# Altium schematic sheet Power_Sheet.SchDoc
size A4; DocumentNumber: 2; SheetNumber: 2; SheetTotal: 4
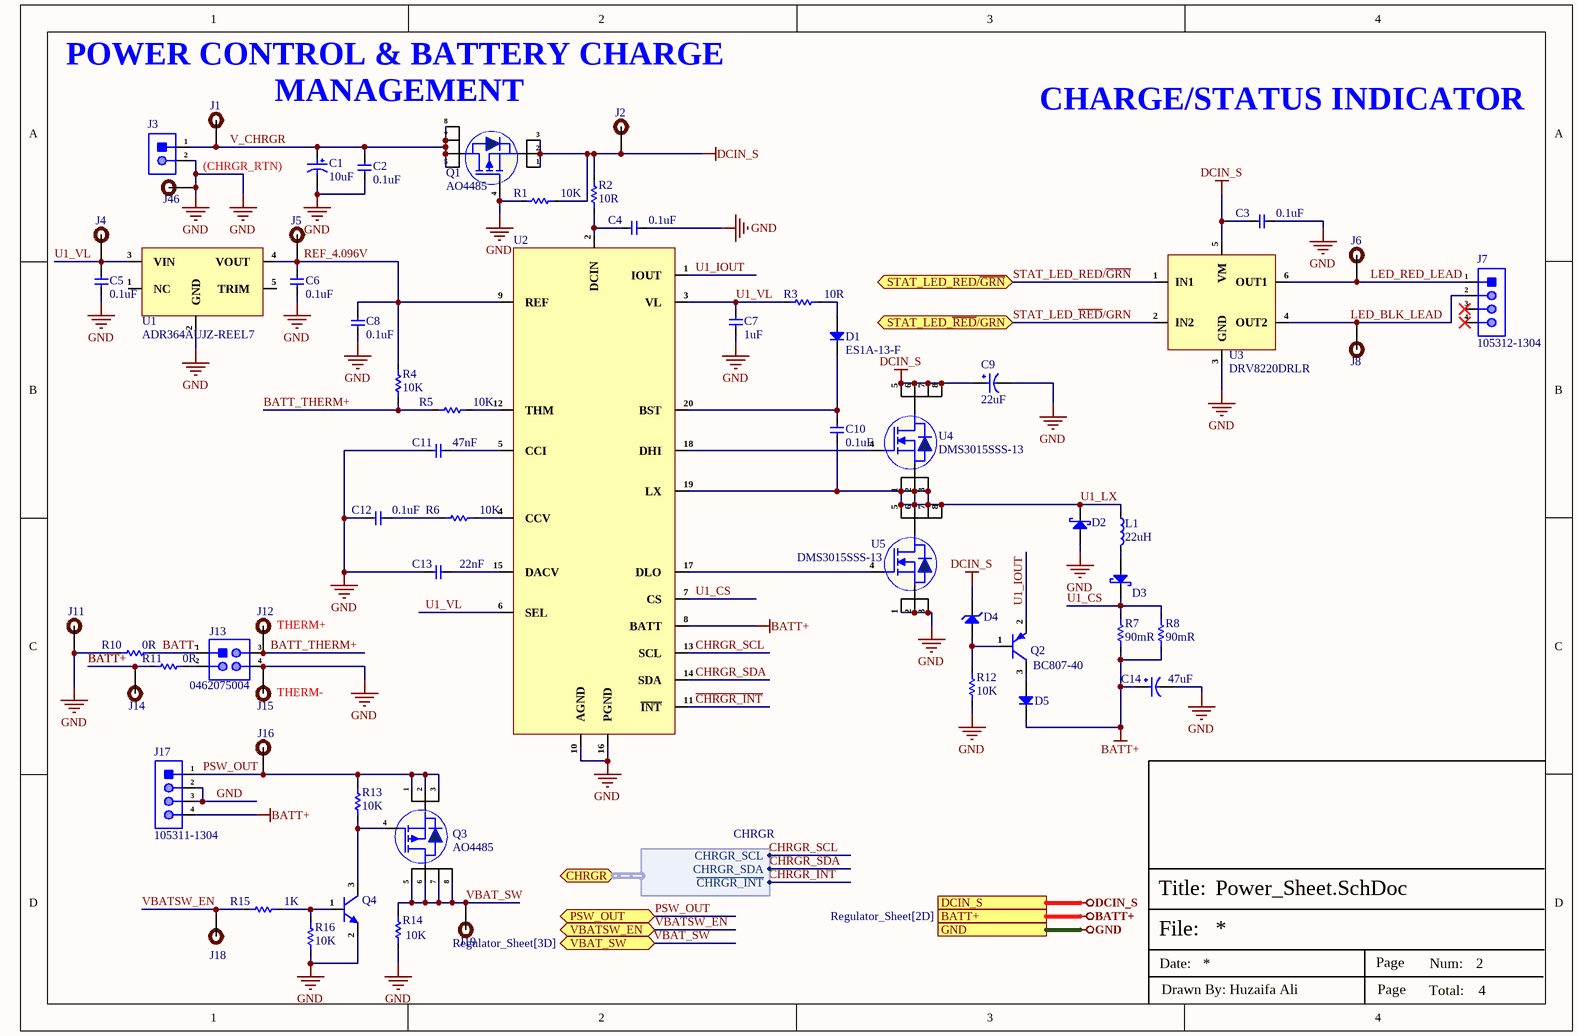
[diagram p0: Power_Sheet.SchDoc]

## Parts
C1  10uF  [EEEFK1E100R_]
C2  0.1uF  [Cap-0603]
C3  0.1uF  [Cap-0402]
C4  0.1uF  [Cap-0402]
C5  0.1uF  [Cap-0402]
C6  0.1uF  [Cap-0402]
C7  1uF  [Cap-0603]
C8  0.1uF  [Cap-0603]
C9  22uF  [Case-D]
C10  0.1uF  [Cap-0402]
C11  47nF  [Cap-0603]
C12  0.1uF  [Cap-0603]
C13  22nF  [Cap-0603]
C14  47uF  [Case-D]
D1  ES1A-13-F  [SMA]
D2  B560CQ-13-F  [SMC]  (value not drawn)
D3  B560CQ-13-F  [SMC]  (value not drawn)
D4  BZD27C4V3P-E3-08  [DO-219AB (SMF)]  (value not drawn)
D5  ES1A-13-F  [SMA]  (value not drawn)
J1  Test Point -TH 1.8mm Hole size 0.92mm  [Test Point -TH 1.8mm Hole size 0.92mm]  (value not drawn)  (no BOM)
J2  Test Point -TH 1.8mm Hole size 0.92mm  [Test Point -TH 1.8mm Hole size 0.92mm]  (value not drawn)  (no BOM)
J3  1053111302  [1053111302]  (value not drawn)
J4  Test Point -TH 1.8mm Hole size 0.92mm  [Test Point -TH 1.8mm Hole size 0.92mm]  (value not drawn)  (no BOM)
J5  Test Point -TH 1.8mm Hole size 0.92mm  [Test Point -TH 1.8mm Hole size 0.92mm]  (value not drawn)  (no BOM)
J6  Test Point -TH 1.8mm Hole size 0.92mm  [Test Point -TH 1.8mm Hole size 0.92mm]  (value not drawn)  (no BOM)
J7  105312-1304  [105312-1304]
J8  Test Point -TH 1.8mm Hole size 0.92mm  [Test Point -TH 1.8mm Hole size 0.92mm]  (value not drawn)  (no BOM)
J11  Test Point -TH 1.8mm Hole size 0.92mm  [Test Point -TH 1.8mm Hole size 0.92mm]  (value not drawn)  (no BOM)
J12  Test Point -TH 1.8mm Hole size 0.92mm  [Test Point -TH 1.8mm Hole size 0.92mm]  (value not drawn)  (no BOM)
J13  0462075004  [0462075004]
J14  Test Point -TH 1.8mm Hole size 0.92mm  [Test Point -TH 1.8mm Hole size 0.92mm]  (value not drawn)  (no BOM)
J15  Test Point -TH 1.8mm Hole size 0.92mm  [Test Point -TH 1.8mm Hole size 0.92mm]  (value not drawn)  (no BOM)
J16  Test Point -TH 1.8mm Hole size 0.92mm  [Test Point -TH 1.8mm Hole size 0.92mm]  (value not drawn)  (no BOM)
J17  105311-1304  [1053111304]
J18  Test Point -TH 1.8mm Hole size 0.92mm  [Test Point -TH 1.8mm Hole size 0.92mm]  (value not drawn)  (no BOM)
J19  Test Point -TH 1.8mm Hole size 0.92mm  [Test Point -TH 1.8mm Hole size 0.92mm]  (value not drawn)  (no BOM)
J46  Test Point -TH 1.8mm Hole size 0.92mm  [Test Point -TH 1.8mm Hole size 0.92mm]  (value not drawn)  (no BOM)
L1  22uH  [DR127-220-R]
Q1  AO4485  [SOIC-8]
Q2  BC807-40  [SOT-23]
Q3  AO4485  [SOIC-8]
Q4  MMBT2222ATT3G  [MMBT2222ATT3G]  (value not drawn)
R1  10K  [Res-0402]
R2  10R  [Res-0402]
R3  10R  [Res-0402]
R4  10K  [Res-0603]
R5  10K  [Res-0603]
R6  10K  [Res-0603]
R7  90mR  [RES-2512]
R8  90mR  [RES-2512]
R10  0R  [Res-0805]
R11  0R  [Res-0805]
R12  10K  [Res-0603]
R13  10K  [Res-0603]
R14  10K  [Res-0603]
R15  1K  [Res-0603]
R16  10K  [Res-0603]
U1  ADR364AUJZ-REEL7  [TSOT-23-5]
U2  MAX1647EAP+  [SSOP-20-208mil]  (value not drawn)
U3  DRV8220DRLR  [SOT-563]
U4  DMS3015SSS-13  [SOP-8]
U5  DMS3015SSS-13  [SOP-8]

## Ports
BATT+ (see Regulator_Sheet[2D]), CHRGR (bidir, harness CHRGR, see Controller_Sheet[4B]), DCIN_S (see Controller_Sheet[4A], Regulator_Sheet[2D]), GND (see Controller_Sheet[4A], Regulator_Sheet[2D]), PSW_OUT (bidir, see Controller_Sheet[4A], Regulator_Sheet[3D]), STAT_LED_RED/~{GRN} (bidir, see Controller_Sheet[3A]), STAT_LED_~{RED}/GRN (bidir, see Controller_Sheet[3B]), VBAT_SW (bidir, see Regulator_Sheet[3D]), VBATSW_EN (bidir, see Controller_Sheet[4A])

## Harnesses
CHRGR: CHRGR_SCL, CHRGR_SDA, ~{CHRGR_INT}

## Nets
BATT+: C14.1 D5.1(K) J14.1 J17.4 R7.2 R8.2 R11.1 U2.8(BATT) ; port BATT+
DCIN_S: C3.1 C9.1 D4.2(K) J2.1 Q1.1(S) Q1.2(S) Q1.3(S) R1.2 R2.2 U3.5(VM) U4.5(D) U4.6(D) U4.7(D) U4.8(D) ; port DCIN_S
GND: C1.2 C2.1 C3.2 C4.2 C5.2 C6.2 C7.2 C8.1 C9.2 C11.1 C12.2 C13.1 C14.2 D2.2(A) J3.2 J11.1 J13.4 J15.1 J17.2 J17.3 J46.1 Q1.4(G) Q4.2(E) R1.1 R10.1 R12.2 R14.1 R16.2 U1.2(GND) U2.10(AGND) U2.16(PGND) U3.3(GND) U5.1(S) U5.2(S) U5.3(S) ; port GND
BATT-: J13.1 R10.2
BATT_THERM+: J12.1 J13.3 R4.2 R5.2
~{CHRGR_INT}: U2.11(~{INT}) ; port CHRGR.~{CHRGR_INT}
CHRGR_SCL: U2.13(SCL) ; port CHRGR.CHRGR_SCL
CHRGR_SDA: U2.14(SDA) ; port CHRGR.CHRGR_SDA
LED_BLK_LEAD: J7.2 J8.1 U3.4(OUT2)
LED_RED_LEAD: J6.1 J7.1 U3.6(OUT1)
PSW_OUT: J16.1 J17.1 Q3.1(S) Q3.2(S) Q3.3(S) R13.1 ; port PSW_OUT
REF_4.096V: C6.1 C8.2 J5.1 R4.1 U1.4(VOUT) U2.9(REF)
STAT_LED_~{RED}/GRN: U3.2(IN2) ; port STAT_LED_~{RED}/GRN
STAT_LED_RED/~{GRN}: U3.1(IN1) ; port STAT_LED_RED/~{GRN}
U1_CS: D3.1(K) R7.1 R8.1 U2.7(CS)
U1_IOUT: Q2.2(E) U2.1(IOUT)
U1_LX: C10.2 D2.1(K) L1.1 U2.19(LX) U4.1(S) U4.2(S) U4.3(S) U5.5(D) U5.6(D) U5.7(D) U5.8(D)
U1_VL: C5.1 C7.1 J4.1 R3.2 U1.3(VIN) U2.3(VL) U2.6(SEL)
V_CHRGR: C1.1 C2.2 J1.1 J3.1 Q1.5(D) Q1.6(D) Q1.7(D) Q1.8(D)
VBAT_SW: J19.1 Q3.5(D) Q3.6(D) Q3.7(D) Q3.8(D) R14.2
VBATSW_EN: J18.1 R15.1 ; port VBATSW_EN
NetC4_1: C4.1 R2.1 U2.2(DCIN)
NetC10_1: C10.1 D1.1(K) U2.20(BST)
NetC11_2: C11.2 U2.5(CCI)
NetC12_1: C12.1 R6.2
NetC13_2: C13.2 U2.15(DACV)
NetD1_2: D1.2(A) R3.1
NetD3_2: D3.2(A) L1.2
NetD4_1: D4.1(A) Q2.1(B) R12.1
NetD5_2: D5.2(A) Q2.3(C)
NetJ13_2: J13.2 R11.2
NetQ3_4: Q3.4(G) Q4.3(C) R13.2
NetQ4_1: Q4.1(B) R15.2 R16.1
NetR5_1: R5.1 U2.12(THM)
NetR6_1: R6.1 U2.4(CCV)
NetU2_17: U2.17(DLO) U5.4(G)
NetU2_18: U2.18(DHI) U4.4(G)

Not connected (* = marked no-connect by the designer): J7 3* 4*; U1 1(NC) 5(TRIM)

## Notes on the sheet
- POWER CONTROL & BATTERY CHARGE
  MANAGEMENT
- CHARGE/STATUS INDICATOR
- (CHRGR_RTN)
- (near J12) THERM+
- (near J15) THERM-
- Labels drawn without touching a wire or pin: VBAT_SW
- File:
- Title:
- Date:
- Page
- Num:
- Total:
- Drawn By: Huzaifa Ali

## Library data of the parts
C1 = EEEFK1E100R: CAP ALUM 10UF 20% 25V SMD; Manufacturer: Panasonic; Manufacturer Part Number: EEE-FK1E100R; Dielectric Material: Aluminium; Ripple Current: 90mA; ESR (Equivalent Series Resistance): 1.35R; Polarity: Polar; Life (Hours): 2000Hour; Leakage Current: 3uA; Supplier 1: Digi-Key; Stock 1: 332; Pricing 1: 1=0.38, 10=0.264, 50=0.1852, 100=0.1587, 500=0.11902, 1000=0.10051 (USD); Mount: Surface Mount,PCB; Case/Package: Radial; Number of Pins: 2; Contact Plating: Tin; Min Operating Temperature: -55°C; Max Operating Temperature: 105°C; Capacitance: 10uF; Tolerance: 20%; Voltage Rating (DC): 25V; Packaging: Tape and Reel; Voltage Rating: 25V; Ripple Current (AC): 90mA; Impedance: 1.35R; Package Quantity: 1; Termination: SMD/SMT; Voltage: 25V; Series: FK; Construction: Cylindrical; Diameter: 4mm; Length: 5.8mm; Width: 5.5mm; Height: 5.8mm; Height - Seated (Max): 0.24inch; Radiation Hardening: No; REACH SVHC: No SVHC; Lead Free: Lead Free; RoHS Compliant: Yes; ComponentLink1URL: http://www.jameco.com/Jameco/Products/ProdDS/1357642.pdf?src-supplier=Jameco; ComponentLink1Description: http://www.jameco.com/Jameco/Products/ProdDS/1357642.pdf?src-supplier=Jameco; ComponentLink2URL: http://www.farnell.com/datasheets/2002520.pdf?src-supplier=Farnell; ComponentLink2Description: http://www.farnell.com/datasheets/2002520.pdf?src-supplier=Farnell; ComponentLink3URL: http://www.farnell.com/datasheets/58258.pdf?src-supplier=Element14; ComponentLink3Description: http://www.farnell.com/datasheets/58258.pdf?src-supplier=Element14; ComponentLink4URL: http://www.mouser.com/ds/2/315/ABA0000CE120-68386.pdf?src-supplier=Mouser; ComponentLink4Description: http://www.mouser.com/ds/2/315/ABA0000CE120-68386.pdf?src-supplier=Mouser; ComponentLink5URL: http://uk.rs-online.com/webdocs/139e/0900766b8139e400.pdf?src-supplier=RSComponents; ComponentLink5Description: http://uk.rs-online.com/webdocs/139e/0900766b8139e400.pdf?src-supplier=RSComponents; ComponentLink6URL: http://www.farnell.com/datasheets/2813657.pdf?src-supplier=Farnell; ComponentLink6Description: http://www.farnell.com/datasheets/2813657.pdf?src-supplier=Farnell; ComponentLink7URL: http://www.farnell.com/datasheets/2002520.pdf?src-supplier=Element14; ComponentLink7Description: http://www.farnell.com/datasheets/2002520.pdf?src-supplier=Element14; ComponentLink8URL: http://www.farnell.com/datasheets/1676921.pdf?src-supplier=Element14; ComponentLink8Description: http://www.farnell.com/datasheets/1676921.pdf?src-supplier=Element14; ComponentLink9URL: http://industrial.panasonic.com/www-data/pdf/ABA0000/ABA0000CE120.pdf?src-supplier=Avnet; ComponentLink9Description: http://industrial.panasonic.com/www-data/pdf/ABA0000/ABA0000CE120.pdf?src-supplier=Avnet; ComponentLink10URL: http://industrial.panasonic.com/www-data/pdf/ABA0000/ABA0000CE120.pdf?src-supplier=Future+Electronics; ComponentLink10Description: http://industrial.panasonic.com/www-data/pdf/ABA0000/ABA0000CE120.pdf?src-supplier=Future+Electronics; ComponentLink11URL: https://www.verical.com/server-webapp/html/getDatasheet?partID=134702&src-supplier=Verical; ComponentLink11Description: https://www.verical.com/server-webapp/html/getDatasheet?partID=134702&src-supplier=Verical; ComponentLink12URL: http://industrial.panasonic.com/www-data/pdf/ABA0000/ABA0000CE120.pdf?src-supplier=Avnet+Europe; ComponentLink12Description: http://industrial.panasonic.com/www-data/pdf/ABA0000/ABA0000CE120.pdf?src-supplier=Avnet+Europe; Supplier Part Number 1: PCE3795CT-ND; LCSC Part Number: C178538
C2 C8 C12 = CL10B104KB8NNNC: CAP CER 0.1UF 50V X7R 0603; Manufacturer: Samsung; Material: Ceramic; Capacitance: 100nF; Tolerance: 10%; Supplier 1: Digi-Key; Manufacturer Part Number: CL10B104KB8NNNC; RoHS: Yes; Category: Ceramic Capacitors; Stock 1: 3998791; Pricing 1: 1=0.10000, 10=0.03000, 50=0.01640, 100=0.01340, 500=0.00954, 1000=0.00750 (USD); Mount: Surface Mount; Case/Package: 0603; Case Code (Metric): 1608; Case Code (Imperial): 0603; Contact Plating: Tin; Min Operating Temperature: -55°C; Max Operating Temperature: 125°C; Dielectric: X7R; Voltage Rating: 50V; Package Quantity: 1; Packaging: Tape and Reel; Voltage: 50V; Voltage Rating (DC): 50V; Series: CL; Construction: Flat; Length: 1.6mm; Width: 0.031inch; Height: 0.8mm; Depth: 0.8mm; Thickness: 0.035inch; Radiation Hardening: No; Lead Free: Lead Free; RoHS Compliant: Yes; ComponentLink1URL: https://datasheet.ciiva.com/25803/cl10b104kb8nnnc-25803393.pdf?src-supplier=Digi-Key; ComponentLink1Description: https://datasheet.ciiva.com/25803/cl10b104kb8nnnc-25803393.pdf?src-supplier=Digi-Key; ComponentLink2URL: https://datasheet.ciiva.com/26838/getdatasheetpartid-89097-26838411.pdf?src-supplier=Verical; ComponentLink2Description: https://datasheet.ciiva.com/26838/getdatasheetpartid-89097-26838411.pdf?src-supplier=Verical; ComponentLink3URL: https://datasheet.ciiva.com/29198/456651-da-01-en-vs-kondensator-0605-29198839.pdf?src-supplier=Conrad; ComponentLink3Description: https://datasheet.ciiva.com/29198/456651-da-01-en-vs-kondensator-0605-29198839.pdf?src-supplier=Conrad; Supplier Part Number 1: 1276-1000-1-ND; LCSC Part Number: C1591
C3-C6 C10 = GRM155R71C104KA88D: CAP CER 0.1UF 16V X7R 0402; Manufacturer: Murata; Material: Ceramic; Value: 100nF; Tolerance: 10%; Insulation Resistance: 10GR; Item Type: Capacitor; Supplier 1: Arrow Electronics; Manufacturer Part Number: GRM155R71C104KA88D; RoHS: Yes; Category: Ceramic Capacitors; Stock 1: 1690322; Pricing 1: 10000=0.00480, 30000=0.00470, 100000=0.00350, 250000=0.00330 (USD); Mounting Technology: Surface Mount; Case/Package: 0402; Pins: 2; Case Code (Metric): 1005; Case Code (Imperial): 0402; Dielectric Material: Ceramic; Min Operating Temperature: -55°C; Max Operating Temperature: 125°C; Voltage Rating: 16V; Packaging: Tape and Reel; Voltage Rating (DC): 16V; Package Quantity: 1; Dielectric: X7R; Termination: SMD/SMT; Voltage: 16V; Series: GRM; Length: 1mm; Width: 0.02inch; Height: 0.5mm; Thickness: 0.022inch; Depth: 0.5mm; Radiation Hardening: No; Lead Free: Lead Free; RoHS Compliant: Yes; ComponentLink1URL: https://datasheet.ciiva.com/129/grm155r71c104ka88-01-129739.pdf?src-supplier=Digi-Key; ComponentLink1Description: https://datasheet.ciiva.com/129/grm155r71c104ka88-01-129739.pdf?src-supplier=Digi-Key; ComponentLink2URL: https://datasheet.ciiva.com/129/grm155r71c104ka88-01-129740.pdf?src-supplier=Digi-Key; ComponentLink2Description: https://datasheet.ciiva.com/129/grm155r71c104ka88-01-129740.pdf?src-supplier=Digi-Key; ComponentLink3URL: https://datasheet.ciiva.com/18102/getdatasheetpartid-85307-18102905.pdf?src-supplier=Verical; ComponentLink3Description: https://datasheet.ciiva.com/18102/getdatasheetpartid-85307-18102905.pdf?src-supplier=Verical; ComponentLink4URL: https://datasheet.ciiva.com/29199/454098-da-01-en-vs-kondensator-0402-29199799.pdf?src-supplier=Conrad; ComponentLink4Description: https://datasheet.ciiva.com/29199/454098-da-01-en-vs-kondensator-0402-29199799.pdf?src-supplier=Conrad; ComponentLink5URL: https://datasheet.ciiva.com/7937/4360-7937615.pdf?src-supplier=Element14; ComponentLink5Description: https://datasheet.ciiva.com/7937/4360-7937615.pdf?src-supplier=Element14; ComponentLink6URL: https://datasheet.ciiva.com/14116/grmseries-highdielectrictype-eng-14116878.pdf?src-supplier=Distrelec; ComponentLink6Description: https://datasheet.ciiva.com/14116/grmseries-highdielectrictype-eng-14116878.pdf?src-supplier=Distrelec; ComponentLink7URL: https://datasheet.ciiva.com/14103/grmseries-highdielectrictype-eng-14103750.pdf?src-supplier=Distrelec; ComponentLink7Description: https://datasheet.ciiva.com/14103/grmseries-highdielectrictype-eng-14103750.pdf?src-supplier=Distrelec; ComponentLink8URL: https://datasheet.ciiva.com/28534/4360-28534127.pdf?src-supplier=Element14; ComponentLink8Description: https://datasheet.ciiva.com/28534/4360-28534127.pdf?src-supplier=Element14; ComponentLink9URL: https://datasheet.ciiva.com/28534/4360-28534133.pdf?src-supplier=Element14; ComponentLink9Description: https://datasheet.ciiva.com/28534/4360-28534133.pdf?src-supplier=Element14; ComponentLink10URL: https://datasheet.ciiva.com/16199/product-16199000.pdf?src-supplier=Future+Electronics; ComponentLink10Description: https://datasheet.ciiva.com/16199/product-16199000.pdf?src-supplier=Future+Electronics; Supplier Part Number 1: GRM155R71C104KA88D; LCSC Part Number: C71629
C7 = CC0603KRX5R8BB105: CAP CER 1UF 25V X5R 0603; Manufacturer: Yageo; Tolerance: 10%; Item Type: Capacitor; Supplier 1: Digi-Key; Manufacturer Part Number: CC0603KRX5R8BB105; RoHS: Yes; Category: Ceramic Capacitors; Stock 1: 919939; Pricing 1: 1=0.12000, 10=0.08400, 50=0.04760, 100=0.03940, 500=0.02764, 1000=0.02288 (USD); Mount: Surface Mount; Case/Package: 0603; Number of Pins: 2; Case Code (Metric): 1608; Case Code (Imperial): 0603; Min Operating Temperature: -55°C; Max Operating Temperature: 85°C; Capacitance: 1uF; Dielectric: X5R; Package Quantity: 1; Voltage Rating: 25V; Packaging: Tape and Reel; Termination: SMD/SMT; Voltage Rating (DC): 25V; Series: CC; Construction: Flat; Length: 1.6mm; Width: 0.031inch; Height: 0.8mm; Thickness: 0.035inch; Depth: 0.8mm; Radiation Hardening: No; REACH SVHC: No SVHC; Lead Free: Lead Free; Halogen Free: Halogen Free; RoHS Compliant: Yes; ComponentLink1URL: https://datasheet.ciiva.com/176/mlccorderingcode-176785.pdf?src-supplier=Digi-Key; ComponentLink1Description: https://datasheet.ciiva.com/176/mlccorderingcode-176785.pdf?src-supplier=Digi-Key; ComponentLink2URL: https://datasheet.ciiva.com/176/mlccorderingcode-176786.pdf?src-supplier=Digi-Key; ComponentLink2Description: https://datasheet.ciiva.com/176/mlccorderingcode-176786.pdf?src-supplier=Digi-Key; ComponentLink3URL: https://datasheet.ciiva.com/176/mlccorderingcode-176787.pdf?src-supplier=Digi-Key; ComponentLink3Description: https://datasheet.ciiva.com/176/mlccorderingcode-176787.pdf?src-supplier=Digi-Key; ComponentLink4URL: https://datasheet.ciiva.com/17436/upy-gphc-x5r-4v-to-50v-12-17436952.pdf?src-supplier=Avnet+Europe; ComponentLink4Description: https://datasheet.ciiva.com/17436/upy-gphc-x5r-4v-to-50v-12-17436952.pdf?src-supplier=Avnet+Europe; ComponentLink5URL: https://datasheet.ciiva.com/7978/1525783-7978171.pdf?src-supplier=Element14; ComponentLink5Description: https://datasheet.ciiva.com/7978/1525783-7978171.pdf?src-supplier=Element14; ComponentLink6URL: https://datasheet.ciiva.com/11586/upy-gphc-x5r-4v-to-50v-12-11586318.pdf?src-supplier=Avnet; ComponentLink6Description: https://datasheet.ciiva.com/11586/upy-gphc-x5r-4v-to-50v-12-11586318.pdf?src-supplier=Avnet; Supplier Part Number 1: 311-1445-1-ND; LCSC Part Number: C14664
C9 = T495D226K035ATE3007280: CAP TANT 22UF 10% 35V 2917; Manufacturer: KEMET; Item Type: Capacitor; ESR (Equivalent Series Resistance): 300mR; Polarity: Polar; Dissipation Factor: 6%; Supplier: Digikey; LCSC Part Number: C122326; Manufacturer Part Number: T495D226K035ATE3007280; RoHS: Yes; Pricing: 2500=0.57649 (USD); Case/Package: Molded; Min Operating Temperature: -55°C; Max Operating Temperature: 125°C; Value: 22uF; Tolerance: 10%; Packaging: Tape and Reel; Construction: Flat; Length: 7.3mm; Height: 2.8mm; Depth: 4.3mm; Radiation Hardening: No; RoHS Compliant: Yes; ComponentLink1URL: http://components.arrow.com/part/dataview/42155055S8669486N7429?src-supplier=Arrow+Electronics; ComponentLink1Description: http://components.arrow.com/part/dataview/42155055S8669486N7429?src-supplier=Arrow+Electronics; ComponentLink2URL: http://capacitoredge.kemet.com/capedge2/DataSheet?pn=T495D226K035ATE3007280&src-supplier=Avnet; ComponentLink2Description: http://capacitoredge.kemet.com/capedge2/DataSheet?pn=T495D226K035ATE3007280&src-supplier=Avnet
C11 = CGA3E2X8R1H473M080AA: CAP CER 0.047UF 50V X8R 0603; Manufacturer: TDK; Tolerance: 20%; Item Type: Capacitor; Supplier 1: Digi-Key; Manufacturer Part Number: CGA3E2X8R1H473M080AA; RoHS: Yes; Category: Ceramic Capacitors; Stock 1: 1279; Pricing 1: 1=0.16000, 10=0.11200, 50=0.06360, 100=0.05260, 500=0.03690, 1000=0.03055 (USD); Mount: Surface Mount; Case/Package: 0603; Case Code (Metric): 1608; Weight: 7.1E-05oz; Case Code (Imperial): 0603; Min Operating Temperature: -55°C; Max Operating Temperature: 150°C; Dielectric: X8R; Voltage Rating (DC): 50V; Package Quantity: 4000; Packaging: Tape and Reel; Capacitance: 47nF; Voltage Rating: 50V; Features: High Temperature; Length: 0.063inch; Width: 0.031inch; Height: 0.8mm; Thickness: 0.035inch; Ratings: AEC-Q200; ComponentLink1URL: http://www.mouser.com/ds/2/400/mlcc_automotive_hightemp_en-520039.pdf?src-supplier=Mouser; ComponentLink1Description: http://www.mouser.com/ds/2/400/mlcc_automotive_hightemp_en-520039.pdf?src-supplier=Mouser; ComponentLink2URL: https://product.tdk.com/info/en/catalog/spec/mlccspec_automotive_hightemp_en.pdf?src-supplier=Digi-Key; ComponentLink2Description: https://product.tdk.com/info/en/catalog/spec/mlccspec_automotive_hightemp_en.pdf?src-supplier=Digi-Key; ComponentLink3URL: http://product.tdk.com/en/catalog/datasheets/mlcc_automotive_hightemp_en.pdf?src-supplier=Avnet; ComponentLink3Description: http://product.tdk.com/en/catalog/datasheets/mlcc_automotive_hightemp_en.pdf?src-supplier=Avnet; Supplier Part Number 1: 445-12603-1-ND; LCSC Part Number: C2172709
C13 = CC0603KRX7R9BB223: CAP CER 0.022UF 50V X7R 0603; Manufacturer: Yageo; Dielectric Material: Ceramic; Tolerance: 10%; Insulation Resistance: 100GR; Item Type: Capacitor; Supplier 1: Digi-Key; Manufacturer Part Number: CC0603KRX7R9BB223; RoHS: Yes; Category: Ceramic Capacitors; Stock 1: 119735; Pricing 1: 1=0.10000, 10=0.05500, 50=0.03020, 100=0.02460, 500=0.01760, 1000=0.01383 (USD); Mount: Surface Mount; Case/Package: 0603; Number of Pins: 2; Case Code (Metric): 1608; Case Code (Imperial): 0603; Min Operating Temperature: -55°C; Max Operating Temperature: 125°C; Capacitance: 22nF; Dielectric: X7R; Voltage: 50V; Package Quantity: 1; Voltage Rating: 50V; Packaging: Tape and Reel; Voltage Rating (DC): 50V; Termination: SMD/SMT; Resistor Type: Ceramic; Series: CC; Length: 1.6mm; Width: 0.031inch; Height: 0.8mm; Depth: 0.8mm; Thickness: 0.035inch; Radiation Hardening: No; RoHS Compliant: Yes; REACH SVHC: No SVHC; Lead Free: Lead Free; Halogen Free: Halogen Free; ComponentLink1URL: https://datasheet.ciiva.com/8033/70765-8033869.pdf?src-supplier=Element14; ComponentLink1Description: https://datasheet.ciiva.com/8033/70765-8033869.pdf?src-supplier=Element14; ComponentLink2URL: https://datasheet.ciiva.com/28450/1489800-28450639.pdf?src-supplier=Element14; ComponentLink2Description: https://datasheet.ciiva.com/28450/1489800-28450639.pdf?src-supplier=Element14; ComponentLink3URL: https://datasheet.ciiva.com/8033/1489800-8033867.pdf?src-supplier=Element14; ComponentLink3Description: https://datasheet.ciiva.com/8033/1489800-8033867.pdf?src-supplier=Element14; ComponentLink4URL: https://datasheet.ciiva.com/8033/1489800-8033865.pdf?src-supplier=Element14; ComponentLink4Description: https://datasheet.ciiva.com/8033/1489800-8033865.pdf?src-supplier=Element14; ComponentLink5URL: https://datasheet.ciiva.com/156/mlccorderingcode-156178.pdf?src-supplier=Digi-Key; ComponentLink5Description: https://datasheet.ciiva.com/156/mlccorderingcode-156178.pdf?src-supplier=Digi-Key; ComponentLink6URL: https://datasheet.ciiva.com/156/mlccorderingcode-156177.pdf?src-supplier=Digi-Key; ComponentLink6Description: https://datasheet.ciiva.com/156/mlccorderingcode-156177.pdf?src-supplier=Digi-Key; ComponentLink7URL: https://datasheet.ciiva.com/156/mlccorderingcode-156179.pdf?src-supplier=Digi-Key; ComponentLink7Description: https://datasheet.ciiva.com/156/mlccorderingcode-156179.pdf?src-supplier=Digi-Key; ComponentLink8URL: https://datasheet.ciiva.com/11464/upy-gphc-x7r-6-3v-to-50v-8-11464741.pdf?src-supplier=Avnet; ComponentLink8Description: https://datasheet.ciiva.com/11464/upy-gphc-x7r-6-3v-to-50v-8-11464741.pdf?src-supplier=Avnet; Supplier Part Number 1: 311-1370-1-ND; LCSC Part Number: C106222
C14 = T495D476K025ATE250: CAP TANT 47UF 10% 25V 2917; Manufacturer: KEMET; Item Type: Capacitor; Supplier: Mouser; LCSC Part Number: C1952924; Manufacturer Part Number: T495D476K025ATE250; RoHS: Yes; Stock: 2198; Pricing: 1=1.82, 10=1.29, 50=1.29, 100=1.07, 1000=0.751, 10000=0.67 (USD); ComponentLink1URL: http://www.mouser.com/ds/2/212/KEM_T2071_T495_COTS-1104607.pdf?src-supplier=Mouser; ComponentLink1Description: http://www.mouser.com/ds/2/212/KEM_T2071_T495_COTS-1104607.pdf?src-supplier=Mouser; ComponentLink2URL: http://components.arrow.com/part/dataview/43511451S7939771N7429?src-supplier=Arrow+Electronics; ComponentLink2Description: http://components.arrow.com/part/dataview/43511451S7939771N7429?src-supplier=Arrow+Electronics; ComponentLink3URL: https://datasheet.octopart.com/T495D476K025ATE250-Kemet-datasheet-27203288.pdf?src-supplier=Element14; ComponentLink3Description: https://datasheet.octopart.com/T495D476K025ATE250-Kemet-datasheet-27203288.pdf?src-supplier=Element14; ComponentLink4URL: https://datasheet.octopart.com/T495D476K025ATE250-Kemet-datasheet-9873475.pdf?src-supplier=Newark; ComponentLink4Description: https://datasheet.octopart.com/T495D476K025ATE250-Kemet-datasheet-9873475.pdf?src-supplier=Newark; ComponentLink5URL: http://www.kemet.com/Lists/ProductCatalog/Attachments/261/KEM_T2009_T495.pdf?src-supplier=Avnet; ComponentLink5Description: http://www.kemet.com/Lists/ProductCatalog/Attachments/261/KEM_T2009_T495.pdf?src-supplier=Avnet; ComponentLink6URL: https://api.kemet.com/component-edge/download/datasheet/T495D476K025ATE250.pdf?src-supplier=Digikey; ComponentLink6Description: https://api.kemet.com/component-edge/download/datasheet/T495D476K025ATE250.pdf?src-supplier=Digikey; ComponentLink7URL: https://datasheet.octopart.com/T495D476K025ATE250-KEMET-datasheet-102476631.pdf?src-supplier=Farnell; ComponentLink7Description: https://datasheet.octopart.com/T495D476K025ATE250-KEMET-datasheet-102476631.pdf?src-supplier=Farnell; ComponentLink8URL: https://datasheet.octopart.com/T495D476K025ATE250-KEMET-datasheet-130110683.pdf?src-supplier=TME; ComponentLink8Description: https://datasheet.octopart.com/T495D476K025ATE250-KEMET-datasheet-130110683.pdf?src-supplier=TME
D1 D5 = ES1A-13-F: DIODE GEN PURP 50V 1A SMA; Manufacturer: Diodes; Supplier: Digikey; LCSC Part Number: C674398; Manufacturer Part Number: ES1A-13-F; RoHS: Yes; Item Type: Diodes; Stock: 130862; Pricing: 1=0.47, 10=0.336, 100=0.1693, 500=0.15004, 1000=0.11676, 2000=0.1045 (USD); ComponentLink1URL: https://datasheet.ciiva.com/27052/1540279-27052395.pdf?src-supplier=Jameco; ComponentLink1Description: https://datasheet.ciiva.com/27052/1540279-27052395.pdf?src-supplier=Jameco; ComponentLink2URL: https://datasheet.ciiva.com/7964/ds14001-7964264.pdf?src-supplier=Element14; ComponentLink2Description: https://datasheet.ciiva.com/7964/ds14001-7964264.pdf?src-supplier=Element14; ComponentLink3URL: https://datasheet.ciiva.com/913/ds14001-913221.pdf?src-supplier=Digikey; ComponentLink3Description: https://datasheet.ciiva.com/913/ds14001-913221.pdf?src-supplier=Digikey; ComponentLink4URL: https://datasheet.ciiva.com/913/ds14001-913222.pdf?src-supplier=Digikey; ComponentLink4Description: https://datasheet.ciiva.com/913/ds14001-913222.pdf?src-supplier=Digikey; ComponentLink5URL: https://datasheet.ciiva.com/913/ds14001-913223.pdf?src-supplier=Digikey; ComponentLink5Description: https://datasheet.ciiva.com/913/ds14001-913223.pdf?src-supplier=Digikey; ComponentLink6URL: https://datasheet.ciiva.com/15144/getdatasheetpartid-89769-15144650.pdf?src-supplier=Verical; ComponentLink6Description: https://datasheet.ciiva.com/15144/getdatasheetpartid-89769-15144650.pdf?src-supplier=Verical
D2 D3 = B560CQ-13-F: DIODE SCHOTTKY 60V 5A SMC; Manufacturer: Diodes; Supplier 1: Digikey; Manufacturer Part Number: B560CQ-13-F; RoHS: Yes; Item Type: Diode; Stock 1: 31887; Pricing 1: 1=0.6, 10=0.523, 100=0.3621, 500=0.30252, 1000=0.25747 (USD); Forward Current: 5A; ComponentLink1URL: https://www.diodes.com/assets/Datasheets/B520CQ-B560CQ.pdf?src-supplier=Digikey; ComponentLink1Description: https://www.diodes.com/assets/Datasheets/B520CQ-B560CQ.pdf?src-supplier=Digikey; ComponentLink2URL: https://www.diodes.com/assets/Datasheets/B520CQ_B560CQ.pdf?src-supplier=Digikey; ComponentLink2Description: https://www.diodes.com/assets/Datasheets/B520CQ_B560CQ.pdf?src-supplier=Digikey; Supplier Part Number 1: B560CQ-13-FDICT-ND; LCSC Part Number: C460781
D4 = BZD27C4V3P-E3-08: Zener Diode, 4.3V V(Z), 6.98%, 0.8W, Silicon, Unidirectional, DO-219AB; Manufacturer: Vishay Semiconductors; Item Type: Diodes; Supplier 1: Avnet; Manufacturer Part Number: BZD27C4V3P-E3-08; RoHS: Yes; Stock 1: 3843; Pricing 1: 1=0.402, 25=0.32, 100=0.165, 250=0.149, 500=0.133 (USD); ComponentLink1URL: https://datasheet.ciiva.com/36856/1734670-36856998.pdf?src-supplier=Element14; ComponentLink1Description: https://datasheet.ciiva.com/36856/1734670-36856998.pdf?src-supplier=Element14; Supplier Part Number 1: 20H3622; LCSC Part Number: C3738778
J3 = 1053111302: CONN HEADER VERT 2POS 2.5MM; Manufacturer: Molex; Item Type: Headers; Supplier: Mouser; Supplier Part Number: 538-105311-1302; Manufacturer Part Number: 1053111302; RoHS: No; Stock: 711; Pricing: 1=1.41, 10=0.986, 50=0.986, 100=0.898, 1000=0.746, 10000=0.681 (USD)
J7 = 105312-1304: CONN HEADER VERT 4POS 2.5MM; Manufacturer: Molex; Supplier: Mouser; Supplier Part Number: 538-105312-1304; Manufacturer Part Number: 105312-1304; RoHS: No; Item Type: Header; Stock: 2910; Pricing: 1=1.24, 10=1.06, 50=1.06, 100=0.921, 1000=0.865, 10000=0.865 (USD); ComponentLink1URL: https://www.molex.com/pdm_docs/sd/1053121204_sd.pdf?src-supplier=Digikey; ComponentLink1Description: https://www.molex.com/pdm_docs/sd/1053121204_sd.pdf?src-supplier=Digikey
J13 = 0462075004: MINI-FIT JR LCP VERT. HDR PEGS 4; Manufacturer: Molex; Item Type: Header; Supplier: Digikey; Supplier Part Number: 900-0462075004-ND; Manufacturer Part Number: 0462075004; RoHS: No; Pricing: 4560=4.03702 (USD)
J17 = 105311-1304: CONN HEADER VERT 4POS 2.5MM; Manufacturer: Molex; Supplier 1: Digikey; Manufacturer Part Number: 105311-1304; RoHS: No; Item Type: Header; Stock 1: 2407; Pricing 1: 1=1.89, 10=1.612, 126=1.33143, 1008=1.05111, 4914=0.93198, 10080=0.91096 (USD); ComponentLink1URL: https://www.molex.com/pdm_docs/sd/1053111102_sd.pdf?src-supplier=Digikey; ComponentLink1Description: https://www.molex.com/pdm_docs/sd/1053111102_sd.pdf?src-supplier=Digikey; Supplier Part Number 1: WM15091-ND; LCSC Part Number: C17483525
L1 = DR127-220-R: FIXED IND 22UH 4A 39.1 MOHM SMD; Manufacturer: Eaton Cooper; Item Type: Inductors; Series Resistance: 39.1mR; Supplier 1: Avnet; Manufacturer Part Number: DR127-220-R; RoHS: Yes; Stock 1: 13650; Pricing 1: 350=0.46278 (USD); Lead Free: 5697LeadFree; ComponentLink1URL: https://datasheet.ciiva.com/14667/0900766b8116a153-14667792.pdf?src-supplier=Rs; ComponentLink1Description: https://datasheet.ciiva.com/14667/0900766b8116a153-14667792.pdf?src-supplier=Rs; ComponentLink2URL: https://datasheet.ciiva.com/26858/getdatasheetpartid-250064-26858411.pdf?src-supplier=Verical; ComponentLink2Description: https://datasheet.ciiva.com/26858/getdatasheetpartid-250064-26858411.pdf?src-supplier=Verical; ComponentLink3URL: https://datasheet.ciiva.com/27053/1771712-27053548.pdf?src-supplier=Jameco; ComponentLink3Description: https://datasheet.ciiva.com/27053/1771712-27053548.pdf?src-supplier=Jameco; ComponentLink4URL: https://datasheet.ciiva.com/16433/bus-elx-ds-4315-dr-series-16433965.pdf?src-supplier=Future+Electronics; ComponentLink4Description: https://datasheet.ciiva.com/16433/bus-elx-ds-4315-dr-series-16433965.pdf?src-supplier=Future+Electronics; ComponentLink5URL: https://datasheet.ciiva.com/22771/87246-22771606.pdf?src-supplier=Farnell; ComponentLink5Description: https://datasheet.ciiva.com/22771/87246-22771606.pdf?src-supplier=Farnell; ComponentLink6URL: https://datasheet.ciiva.com/30102/43bus-elx-ds-4315-dr-ser-30102011.pdf?src-supplier=Onlinecomponents.com; ComponentLink6Description: https://datasheet.ciiva.com/30102/43bus-elx-ds-4315-dr-ser-30102011.pdf?src-supplier=Onlinecomponents.com; ComponentLink7URL: https://datasheet.ciiva.com/16940/70037876-16940553.pdf?src-supplier=Allied+Electronics; ComponentLink7Description: https://datasheet.ciiva.com/16940/70037876-16940553.pdf?src-supplier=Allied+Electronics; ComponentLink8URL: https://datasheet.ciiva.com/8004/87246-8004871.pdf?src-supplier=Element14; ComponentLink8Description: https://datasheet.ciiva.com/8004/87246-8004871.pdf?src-supplier=Element14; ComponentLink9URL: https://datasheet.ciiva.com/8005/87246-8005177.pdf?src-supplier=Element14; ComponentLink9Description: https://datasheet.ciiva.com/8005/87246-8005177.pdf?src-supplier=Element14; Supplier Part Number 1: DR127-220-R; LCSC Part Number: C2638525
Q1 Q3 = AO4485: MOSFET P-CH 40V 10A 8SOIC; Manufacturer: Alpha & Omega Semiconductor; Item Type: MOSFETs; Supplier: Digikey; LCSC Part Number: C51499; Manufacturer Part Number: AO4485; RoHS: Yes; Stock: 22089; Pricing: 1=0.89, 10=0.768, 100=0.5318, 500=0.44432, 1000=0.37814 (USD); ComponentLink1URL: https://datasheet.ciiva.com/26861/getdatasheetpartid-417133-26861485.pdf?src-supplier=Verical; ComponentLink1Description: https://datasheet.ciiva.com/26861/getdatasheetpartid-417133-26861485.pdf?src-supplier=Verical; ComponentLink2URL: https://datasheet.ciiva.com/6367/ao4485-6367585.pdf?src-supplier=Digikey; ComponentLink2Description: https://datasheet.ciiva.com/6367/ao4485-6367585.pdf?src-supplier=Digikey
Q2 = BC807-40: 45V 310mW 250@100mA,1V 800mA SOT-23 Bipolar (BJT) ROHS; Manufacturer: KEXIN; Item Type: (BJT); Manufacturer Part Number: BC807-40; Package: SOT-23; LCSC Part Number: C489159; ComponentLink1Description: LCSC; ComponentLink1URL: https://www.lcsc.com/product-detail/Bipolar-BJT_KEXIN-BC807-40_C489159.html
Q4 = MMBT2222ATT3G: Small Signal Bipolar Transistor, 0.6A I(C), 40V V(BR)CEO, 1-Element, NPN, Silicon; Manufacturer: ON Semiconductor; Supplier: Digikey; Supplier Part Number: MMBT2222ATT3GOSCT-ND; Manufacturer Part Number: MMBT2222ATT3G; RoHS: Yes; Category: BJTs; Stock: 7029; Pricing: 1=0.12, 10=0.082, 100=0.0441, 500=0.03466, 1000=0.02407, 2000=0.01994, 5000=0.01885 (USD); ComponentLink1URL: https://datasheet.ciiva.com/980/mmbt2222lt1-d-980718.pdf?src-supplier=Digikey; ComponentLink1Description: https://datasheet.ciiva.com/980/mmbt2222lt1-d-980718.pdf?src-supplier=Digikey; ComponentLink2URL: https://datasheet.ciiva.com/4724/mmbt2222att1-d-81771-4724629.pdf?src-supplier=Mouser; ComponentLink2Description: https://datasheet.ciiva.com/4724/mmbt2222att1-d-81771-4724629.pdf?src-supplier=Mouser
R1 = RC0402FR-0710KL: RES 10K OHM 1% 1/16W 0402; Manufacturer: Yageo; Resistance: 10kR; Voltage Rating (DC): 50V; Temperature Coefficient: 100ppm/°C; Power Rating: 62.5mW; Max Power Dissipation: 63mW; Item Type: Resistor; Supplier 1: Mouser; Manufacturer Part Number: RC0402FR-0710KL; RoHS: Yes; Category: Chip SMD Resistors; Stock 1: 18648329; Pricing 1: 1=0.10000, 10=0.01400, 50=0.01400, 100=0.00500, 1000=0.00300, 10000=0.00200 (USD); Case/Package: 0402; Number of Pins: 2; Case Code (Imperial): 0402; Case Code (Metric): 1005; Min Operating Temperature: -55°C; Max Operating Temperature: 155°C; Resistor Type: Thick Film; Tolerance: 1%; Packaging: Tape and Reel; Voltage Rating: 50V; Termination: SMD/SMT; Working Voltage: 50V; Number of Terminations: 2; Features: Moisture Resistant; Series: RC; Resistance Tolerance: 1%; Construction: Rectangular; Length: 1mm; Width: 0.5mm; Height: 0.32mm; Depth: 0.5mm; Lead Pitch: 0.2mm; REACH SVHC: No SVHC; Lead Free: Lead Free; RoHS Compliant: Yes; Military Standard: Not; ComponentLink1URL: https://datasheet.ciiva.com/7660/38568-7660787.pdf?src-supplier=Element14; ComponentLink1Description: https://datasheet.ciiva.com/7660/38568-7660787.pdf?src-supplier=Element14; ComponentLink2URL: https://datasheet.ciiva.com/7849/1686128-7849814.pdf?src-supplier=Element14; ComponentLink2Description: https://datasheet.ciiva.com/7849/1686128-7849814.pdf?src-supplier=Element14; ComponentLink3URL: https://datasheet.ciiva.com/7983/1018594-7983486.pdf?src-supplier=Element14; ComponentLink3Description: https://datasheet.ciiva.com/7983/1018594-7983486.pdf?src-supplier=Element14; ComponentLink4URL: https://datasheet.ciiva.com/22747/1018594-22747512.pdf?src-supplier=Element14; ComponentLink4Description: https://datasheet.ciiva.com/22747/1018594-22747512.pdf?src-supplier=Element14; ComponentLink5URL: https://datasheet.ciiva.com/12667/pyu-rc0402-51-rohs-l-6-r-12667067.pdf?src-supplier=Mouser; ComponentLink5Description: https://datasheet.ciiva.com/12667/pyu-rc0402-51-rohs-l-6-r-12667067.pdf?src-supplier=Mouser; ComponentLink6URL: https://datasheet.ciiva.com/7849/1784430-7849813.pdf?src-supplier=Element14; ComponentLink6Description: https://datasheet.ciiva.com/7849/1784430-7849813.pdf?src-supplier=Element14; ComponentLink7URL: https://datasheet.ciiva.com/7849/1784430-7849815.pdf?src-supplier=Element14; ComponentLink7Description: https://datasheet.ciiva.com/7849/1784430-7849815.pdf?src-supplier=Element14; Supplier Part Number 1: 603-RC0402FR-0710KL; LCSC Part Number: C60490
R2 R3 = CRCW040210R0FKEDHP: RES SMD 10 OHM 1% 1/5W 0402; Manufacturer: Vishay Dale; Power Rating: 125mW; Voltage Rating: 50V; Temperature Coefficient: 100ppm/°C; Max Power Dissipation: 200mW; Supplier 1: Digi-Key; Manufacturer Part Number: CRCW040210R0FKEDHP; Stock 1: 28500; Pricing 1: 1=0.15, 10=0.132, 100=0.0506, 1000=0.02226, 2500=0.01923, 5000=0.0172 (USD); Mount: Surface Mount; Case/Package: 0402; Weight: 2.3E-05oz; Case Code (Imperial): 0402; Case Code (Metric): 1005; Contact Plating: Tin; Min Operating Temperature: -55°C; Max Operating Temperature: 155°C; Resistance: 10R; Tolerance: 1%; Packaging: Tape and Reel; Package Quantity: 10000; Termination: SMD/SMT; Resistor Type: Thick Film; Voltage Rating (DC): 50V; Features: Automotive AEC-Q200; Series: CRCW-HP; Number of Terminations: 2; Resistance Tolerance: 1%; Technology: THICK FILM; Construction: Rectangular; Length: 1mm; Width: 0.5mm; Height: 0.3mm; Depth: 0.5mm; Radiation Hardening: No; REACH SVHC: Unknown; Military Standard: Not; Lead Free: Lead Free; RoHS Compliant: Yes; ComponentLink1URL: http://www.mouser.com/ds/2/427/crcwhpe3-46056.pdf?src-supplier=Mouser; ComponentLink1Description: http://www.mouser.com/ds/2/427/crcwhpe3-46056.pdf?src-supplier=Mouser; Supplier Part Number 1: 541-10.0YCT-ND; LCSC Part Number: C4013850
R4-R6 R12 R13 R16 = RK73G1JTTD1002F: RES 10K OHM 1% 1/10W 0603; Item Type: Resistor; Value: 10kR; Power Rating: 100mW; Voltage Rating: 75V; Temperature Coefficient: 50ppm/°C; LCSC Part Number: C362180; ComponentLink1Description: LCSC; Supplier: Digi-Key; Supplier Part Number: 2019-RK73G1JTTD1002FCT-ND; RoHS: Yes; Category: Chip SMD Resistors; Stock: 249394; Pricing: 1=0.22, 10=0.118, 50=0.0812, 100=0.0699, 500=0.0513, 1000=0.04545 (USD); Case/Package: 0603; Case Code (Imperial): 0603; Case Code (Metric): 1608; Min Operating Temperature: -55°C; Max Operating Temperature: 125°C; Tolerance: 1%; Packaging: Tape and Reel; Termination: SMD/SMT; Series: RK73G; Construction: Rectangular; Length: 1.6mm; Depth: 0.8mm; Military Standard: Not; RoHS Compliant: Yes; ComponentLink2URL: http://www.mouser.com/ds/2/219/RK73G-9863.pdf?src-supplier=Mouser; ComponentLink2Description: http://www.mouser.com/ds/2/219/RK73G-9863.pdf?src-supplier=Mouser
R7 R8 = TLRP3A20CR090FTE: Res Current Sense Metal Strip 2512 0.09 Ohm 1% 2W ±25ppm/°C Molded Emboss T/R; Manufacturer: CGS; Supplier: Digikey; Supplier Part Number: 1712-TLRP3A20CR090FTECT-ND; Manufacturer Part Number: TLRP3A20CR090FTE; RoHS: No; Category: Chip SMD Resistors; Stock: 11268; Pricing: 1=0.57, 10=0.453, 25=0.4096, 50=0.3686, 100=0.3045, 250=0.28672, 500=0.23212, 1000=0.18775 (USD); Packaging: 10Packaging; Power Rating: 2W
R10 R11 = RC0805FR-070RL: RES 0 OHM JUMPER 1/8W 0805; Manufacturer: Yageo; Resistance: 0mR; Tolerance: 1%; Power Rating: 125mW; Item Type: Resistor; Supplier 1: Avnet; Manufacturer Part Number: RC0805FR-070RL; RoHS: Yes; Category: Chip SMD Resistors; Stock 1: 85000; Pricing 1: 5000=0.00281, 10000=0.00277, 20000=0.00269 (USD); Case/Package: 0805; Contact Plating: Tin,Matte; Case Code (Imperial): 0805; Case Code (Metric): 2012; Size Code: 0805; Min Operating Temperature: -55°C; Max Operating Temperature: 155°C; Resistor Type: Thick Film; Packaging: Tape and Reel; Features: Moisture Resistant; Series: RC; Max Power Dissipation: 125mW; Number of Terminations: 2; Construction: Rectangular; Length: 2mm; Depth: 1.25mm; Radiation Hardening: No; Military Standard: Not; Lead Free: Lead Free; RoHS Compliant: Yes; ComponentLink1URL: https://datasheet.ciiva.com/15189/getdatasheetpartid-348154-15189885.pdf?src-supplier=Verical; ComponentLink1Description: https://datasheet.ciiva.com/15189/getdatasheetpartid-348154-15189885.pdf?src-supplier=Verical; ComponentLink2URL: https://datasheet.ciiva.com/17042/rc0805-17042698.pdf?src-supplier=Future+Electronics; ComponentLink2Description: https://datasheet.ciiva.com/17042/rc0805-17042698.pdf?src-supplier=Future+Electronics; Supplier Part Number 1: RC0805FR-070RL; LCSC Part Number: C100045
R14 = RT0603BRD0710KL: RES SMD 10K OHM 0.1% 1/10W 0603; Manufacturer: Yageo; Power: 100mW; Rated Temperature: 70°C; Value: 10kR; Temperature Coefficient: 25ppm/°C; Working Voltage: 75V; Package Height: 0.45mm; Package Length: 1.6mm; Package Width: 0.8mm; Item Type: Resistor; Supplier 1: Rs; Manufacturer Part Number: RT0603BRD0710KL; RoHS: Yes; Category: Chip SMD Resistors; Stock 1: 20510; Pricing 1: 100=0.29800, 250=0.27800, 500=0.25900, 1000=0.23700 (GBP); Mounting Technology: Surface Mount; Pins: 2; Case/Package: 0603; Min Operating Temperature: -55°C; Max Operating Temperature: 155°C; Tolerance: 0.1%; Resistor Type: FIXED RESISTOR; Construction: Chip; Package Style: SMTMeter; Packaging: Tape and Reel; Technology: THIN FILM; Termination: Wraparound; Reach SVHC Compliant: Yes; RoHS Compliant: Yes; ComponentLink1URL: https://datasheet.ciiva.com:443/pdfs/VipMasterIC/IC/YAGO/YAGO-S-A0008510989/YAGO-S-A0008510989-1.pdf?src-supplier=IHS+Markit; ComponentLink1Description: https://datasheet.ciiva.com:443/pdfs/VipMasterIC/IC/YAGO/YAGO-S-A0008510989/YAGO-S-A0008510989-1.pdf?src-supplier=IHS+Markit; ComponentLink2URL: https://datasheet.ciiva.com/5624/pyu-rt-1-to-0-05-rohs-l-4-5624351.pdf?src-supplier=Mouser; ComponentLink2Description: https://datasheet.ciiva.com/5624/pyu-rt-1-to-0-05-rohs-l-4-5624351.pdf?src-supplier=Mouser; ComponentLink3URL: https://datasheet.ciiva.com/29721/pyu-rt-1-to-0-05-rohs-l-4-29721177.pdf?src-supplier=Digi-Key; ComponentLink3Description: https://datasheet.ciiva.com/29721/pyu-rt-1-to-0-05-rohs-l-4-29721177.pdf?src-supplier=Digi-Key; Supplier Part Number 1: 1991391P; LCSC Part Number: C95204
R15 = RC0603FR-071KL: RES SMD 1K OHM 1% 1/10W 0603; Manufacturer: Yageo; Resistance: 1kR; Temperature Coefficient: 100ppm/°C; Power Rating: 100mW; Voltage Rating: 50V; Item type: Resistor; ComponentLink1URL: https://www.verical.com/server-webapp/html/getDatasheet?partID=409289&src-supplier=Verical; ComponentLink1Description: https://www.verical.com/server-webapp/html/getDatasheet?partID=409289&src-supplier=Verical; Supplier 1: Digi-Key; Manufacturer Part Number: RC0603FR-071KL; Stock 1: 21472395; Pricing 1: 1=0.1, 10=0.023, 100=0.0094, 1000=0.0042, 2500=0.0037 (USD); Case/Package: 0603; Contact Plating: Tin,Matte; Case Code (Imperial): 0603; Case Code (Metric): 1608; Min Operating Temperature: -55°C; Max Operating Temperature: 155°C; Tolerance: 1%; Composition: Thick Film; Packaging: Tape and Reel; Termination: SMD/SMT; Military Standard: Not; Length: 1.6mm; Height: 0.45mm; Depth: 0.8mm; Radiation Hardening: No; REACH SVHC: No SVHC; Lead Free: Lead Free; ComponentLink2URL: http://documents.rs-components.com/techlib://itc_doclist_GB.htm?stockno=5048928&src-supplier=RSComponents; ComponentLink2Description: http://documents.rs-components.com/techlib://itc_doclist_GB.htm?stockno=5048928&src-supplier=RSComponents; ComponentLink3URL: http://www.yageo.com/documents/recent/PYu-RC0603_51_RoHS_L_4.pdf?src-supplier=Avnet+Europe; ComponentLink3Description: http://www.yageo.com/documents/recent/PYu-RC0603_51_RoHS_L_4.pdf?src-supplier=Avnet+Europe; ComponentLink4URL: http://www.farnell.com/datasheets/2167052.pdf?src-supplier=Element14; ComponentLink4Description: http://www.farnell.com/datasheets/2167052.pdf?src-supplier=Element14; ComponentLink5URL: http://www.farnell.com/datasheets/1868787.pdf?src-supplier=Element14; ComponentLink5Description: http://www.farnell.com/datasheets/1868787.pdf?src-supplier=Element14; ComponentLink6URL: http://www.yageo.com/documents/recent/PYu-RC_Group_51_RoHS_L_2.pdf?src-supplier=Avnet; ComponentLink6Description: http://www.yageo.com/documents/recent/PYu-RC_Group_51_RoHS_L_2.pdf?src-supplier=Avnet; ComponentLink7URL: https://www.verical.com/server-webapp/html/getDatasheet?partID=404327&src-supplier=Verical; ComponentLink7Description: https://www.verical.com/server-webapp/html/getDatasheet?partID=404327&src-supplier=Verical; ComponentLink8URL: http://www.farnell.com/datasheets/443971.pdf?src-supplier=Element14; ComponentLink8Description: http://www.farnell.com/datasheets/443971.pdf?src-supplier=Element14; Supplier Part Number 1: 311-1.00KHRDKR-ND; LCSC Part Number: C22548
U1 = ADR364AUJZ-REEL7: IC VREF SERIES 0.2% TSOT5; Manufacturer: Analog Devices; Supplier: Digikey; LCSC Part Number: C659518; Manufacturer Part Number: ADR364AUJZ-REEL7; RoHS: Yes; Item Type: IC; Stock: 4393; Pricing: 1=2.73, 10=2.452, 25=2.318, 100=2.0089, 250=1.90588, 500=1.71014, 1000=1.44228 (USD); ComponentLink1URL: https://datasheet.ciiva.com/22697/751436-22697083.pdf?src-supplier=Element14; ComponentLink1Description: https://datasheet.ciiva.com/22697/751436-22697083.pdf?src-supplier=Element14; ComponentLink2URL: https://datasheet.ciiva.com/3237/adr360-361-363-364-365-366-3237020.pdf?src-supplier=Avnet; ComponentLink2Description: https://datasheet.ciiva.com/3237/adr360-361-363-364-365-366-3237020.pdf?src-supplier=Avnet; ComponentLink3URL: https://datasheet.ciiva.com/1172/751436-1172568.pdf?src-supplier=Element14; ComponentLink3Description: https://datasheet.ciiva.com/1172/751436-1172568.pdf?src-supplier=Element14
U2 = MAX1647EAP+: Battery Charger Lead-Acid/Li-Ion/NiCD/NiMH 4000mA 18V 20-Pin SSOP; Manufacturer: Maxim; Item Type: IC; Output Current: 4A; Operating Supply Voltage: 28V; Supplier 1: Mouser; Manufacturer Part Number: MAX1647EAP+; RoHS: Yes; Stock 1: 19; Pricing 1: 1=14.28, 10=13.13, 50=12.59, 100=11.09, 1000=9.86, 10000=9.86 (USD); Mount: Surface Mount; Case/Package: SSOP; Min Operating Temperature: -40°C; Max Operating Temperature: 85°C; Packaging: Rail/Tube; Radiation Hardening: No; RoHS Compliant: Yes; ComponentLink1URL: http://datasheets.maxim-ic.com/en/ds/MAX1647-MAX1648.pdf?src-supplier=Avnet; ComponentLink1Description: http://datasheets.maxim-ic.com/en/ds/MAX1647-MAX1648.pdf?src-supplier=Avnet; Supplier Part Number 1: 700-MAX1647EAP+; LCSC Part Number: C7456664
U3 = DRV8220DRLR: 20-V, 1-A H-BRIDGE MOTOR DRIVER; Manufacturer: Texas Instruments; Item Type: IC; Number of Channels: 1NUMBER; Supplier: Mouser; LCSC Part Number: C3681351; Manufacturer Part Number: DRV8220DRLR; RoHS: No; Stock: 3584; Pricing: 1=0.76, 10=0.627, 50=0.627, 100=0.475, 1000=0.324, 10000=0.262 (USD); Pins: 6NUMBER; Length: 1.6mm; Width: 1.2mm; Height: 600um; Thickness: 550um
U4 U5 = DMS3015SSS-13: MOSFET N-CH 30V 11A 8SO; Manufacturer: Diodes; Item Type: IC; Supplier: Digikey; Supplier Part Number: DMS3015SSS-13DICT-ND; Manufacturer Part Number: DMS3015SSS-13; RoHS: Yes; Stock: 41483; Pricing: 1=0.43, 10=0.366, 100=0.2543, 500=0.19854, 1000=0.16138 (USD); ComponentLink1URL: https://datasheet.ciiva.com/8115/ds32096-8115505.pdf?src-supplier=Avnet; ComponentLink1Description: https://datasheet.ciiva.com/8115/ds32096-8115505.pdf?src-supplier=Avnet; ComponentLink2URL: https://datasheet.ciiva.com/4443/ds32096-88633-4443151.pdf?src-supplier=Mouser; ComponentLink2Description: https://datasheet.ciiva.com/4443/ds32096-88633-4443151.pdf?src-supplier=Mouser; ComponentLink3URL: https://datasheet.ciiva.com/6367/ds32096-6367776.pdf?src-supplier=Digikey; ComponentLink3Description: https://datasheet.ciiva.com/6367/ds32096-6367776.pdf?src-supplier=Digikey; ComponentLink4URL: https://datasheet.ciiva.com/6367/ds32096-6367773.pdf?src-supplier=Digikey; ComponentLink4Description: https://datasheet.ciiva.com/6367/ds32096-6367773.pdf?src-supplier=Digikey; ComponentLink5URL: https://datasheet.ciiva.com/6367/ds32096-6367774.pdf?src-supplier=Digikey; ComponentLink5Description: https://datasheet.ciiva.com/6367/ds32096-6367774.pdf?src-supplier=Digikey